# Altium schematic sheet Microcontroller.SchDoc
size A2; SheetNumber: 3; SheetTotal: 3
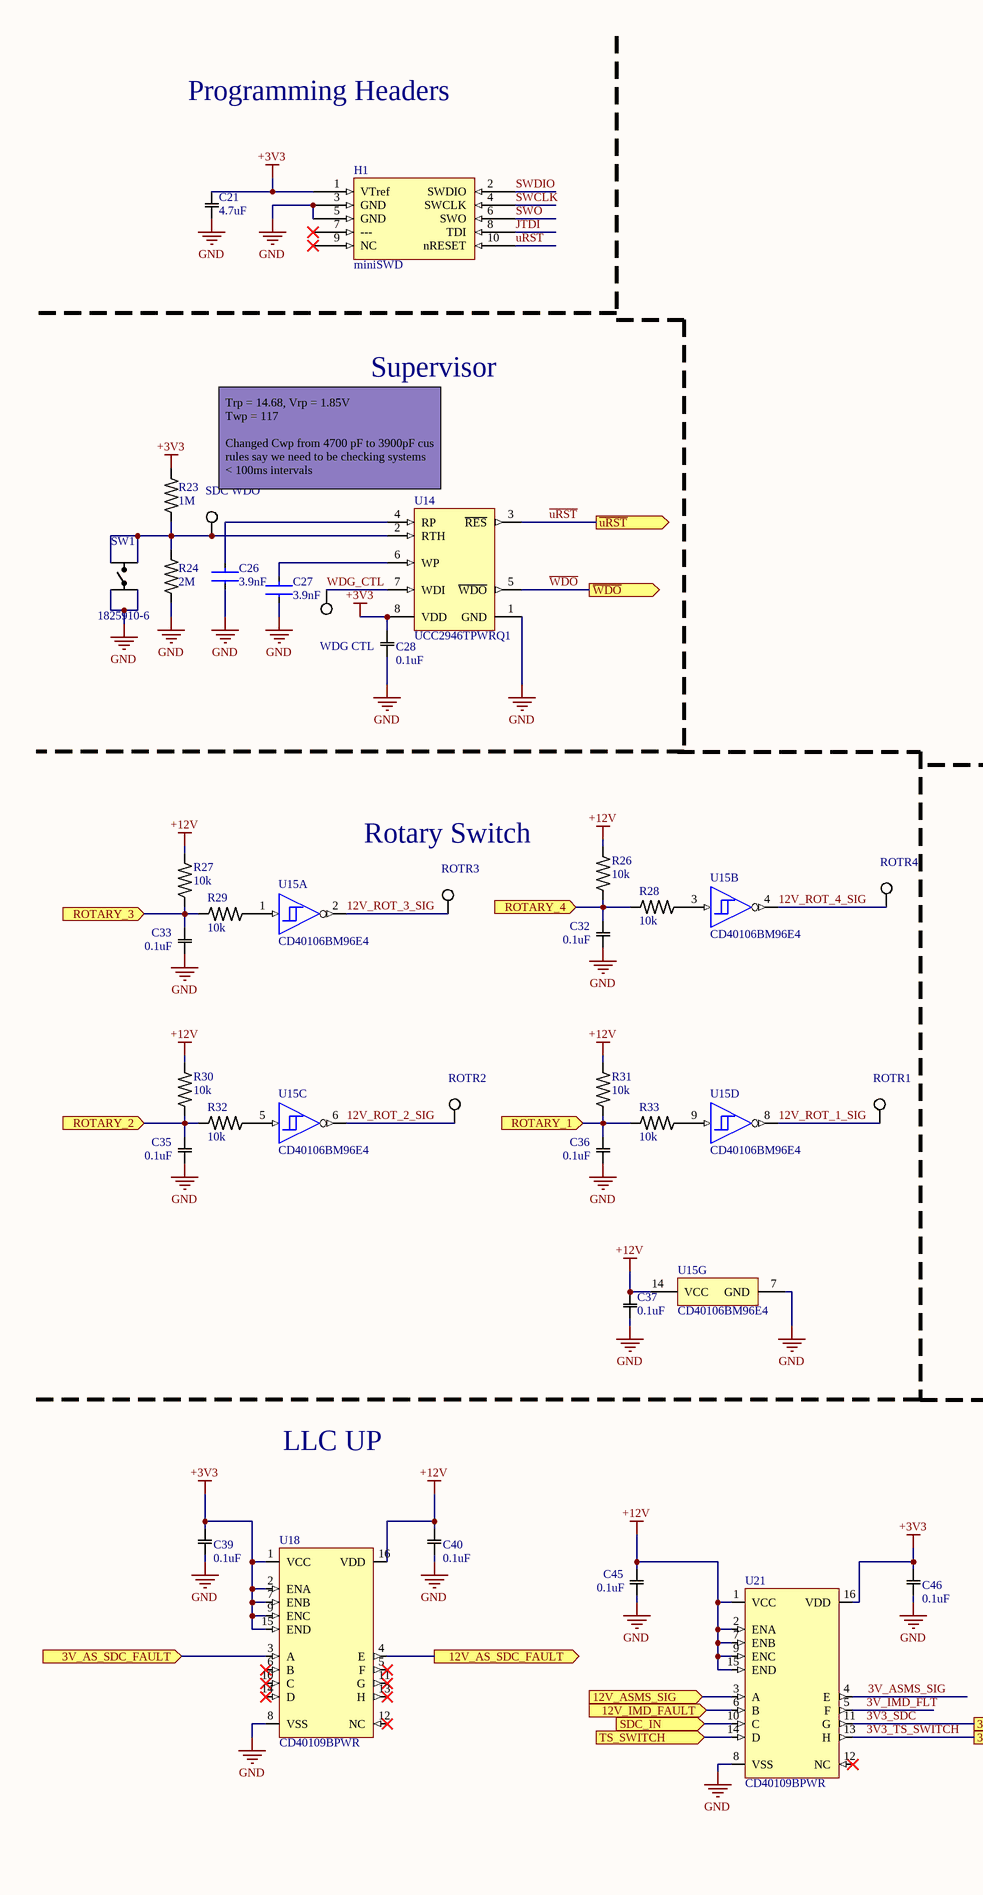
[diagram p0: Microcontroller.SchDoc, left]
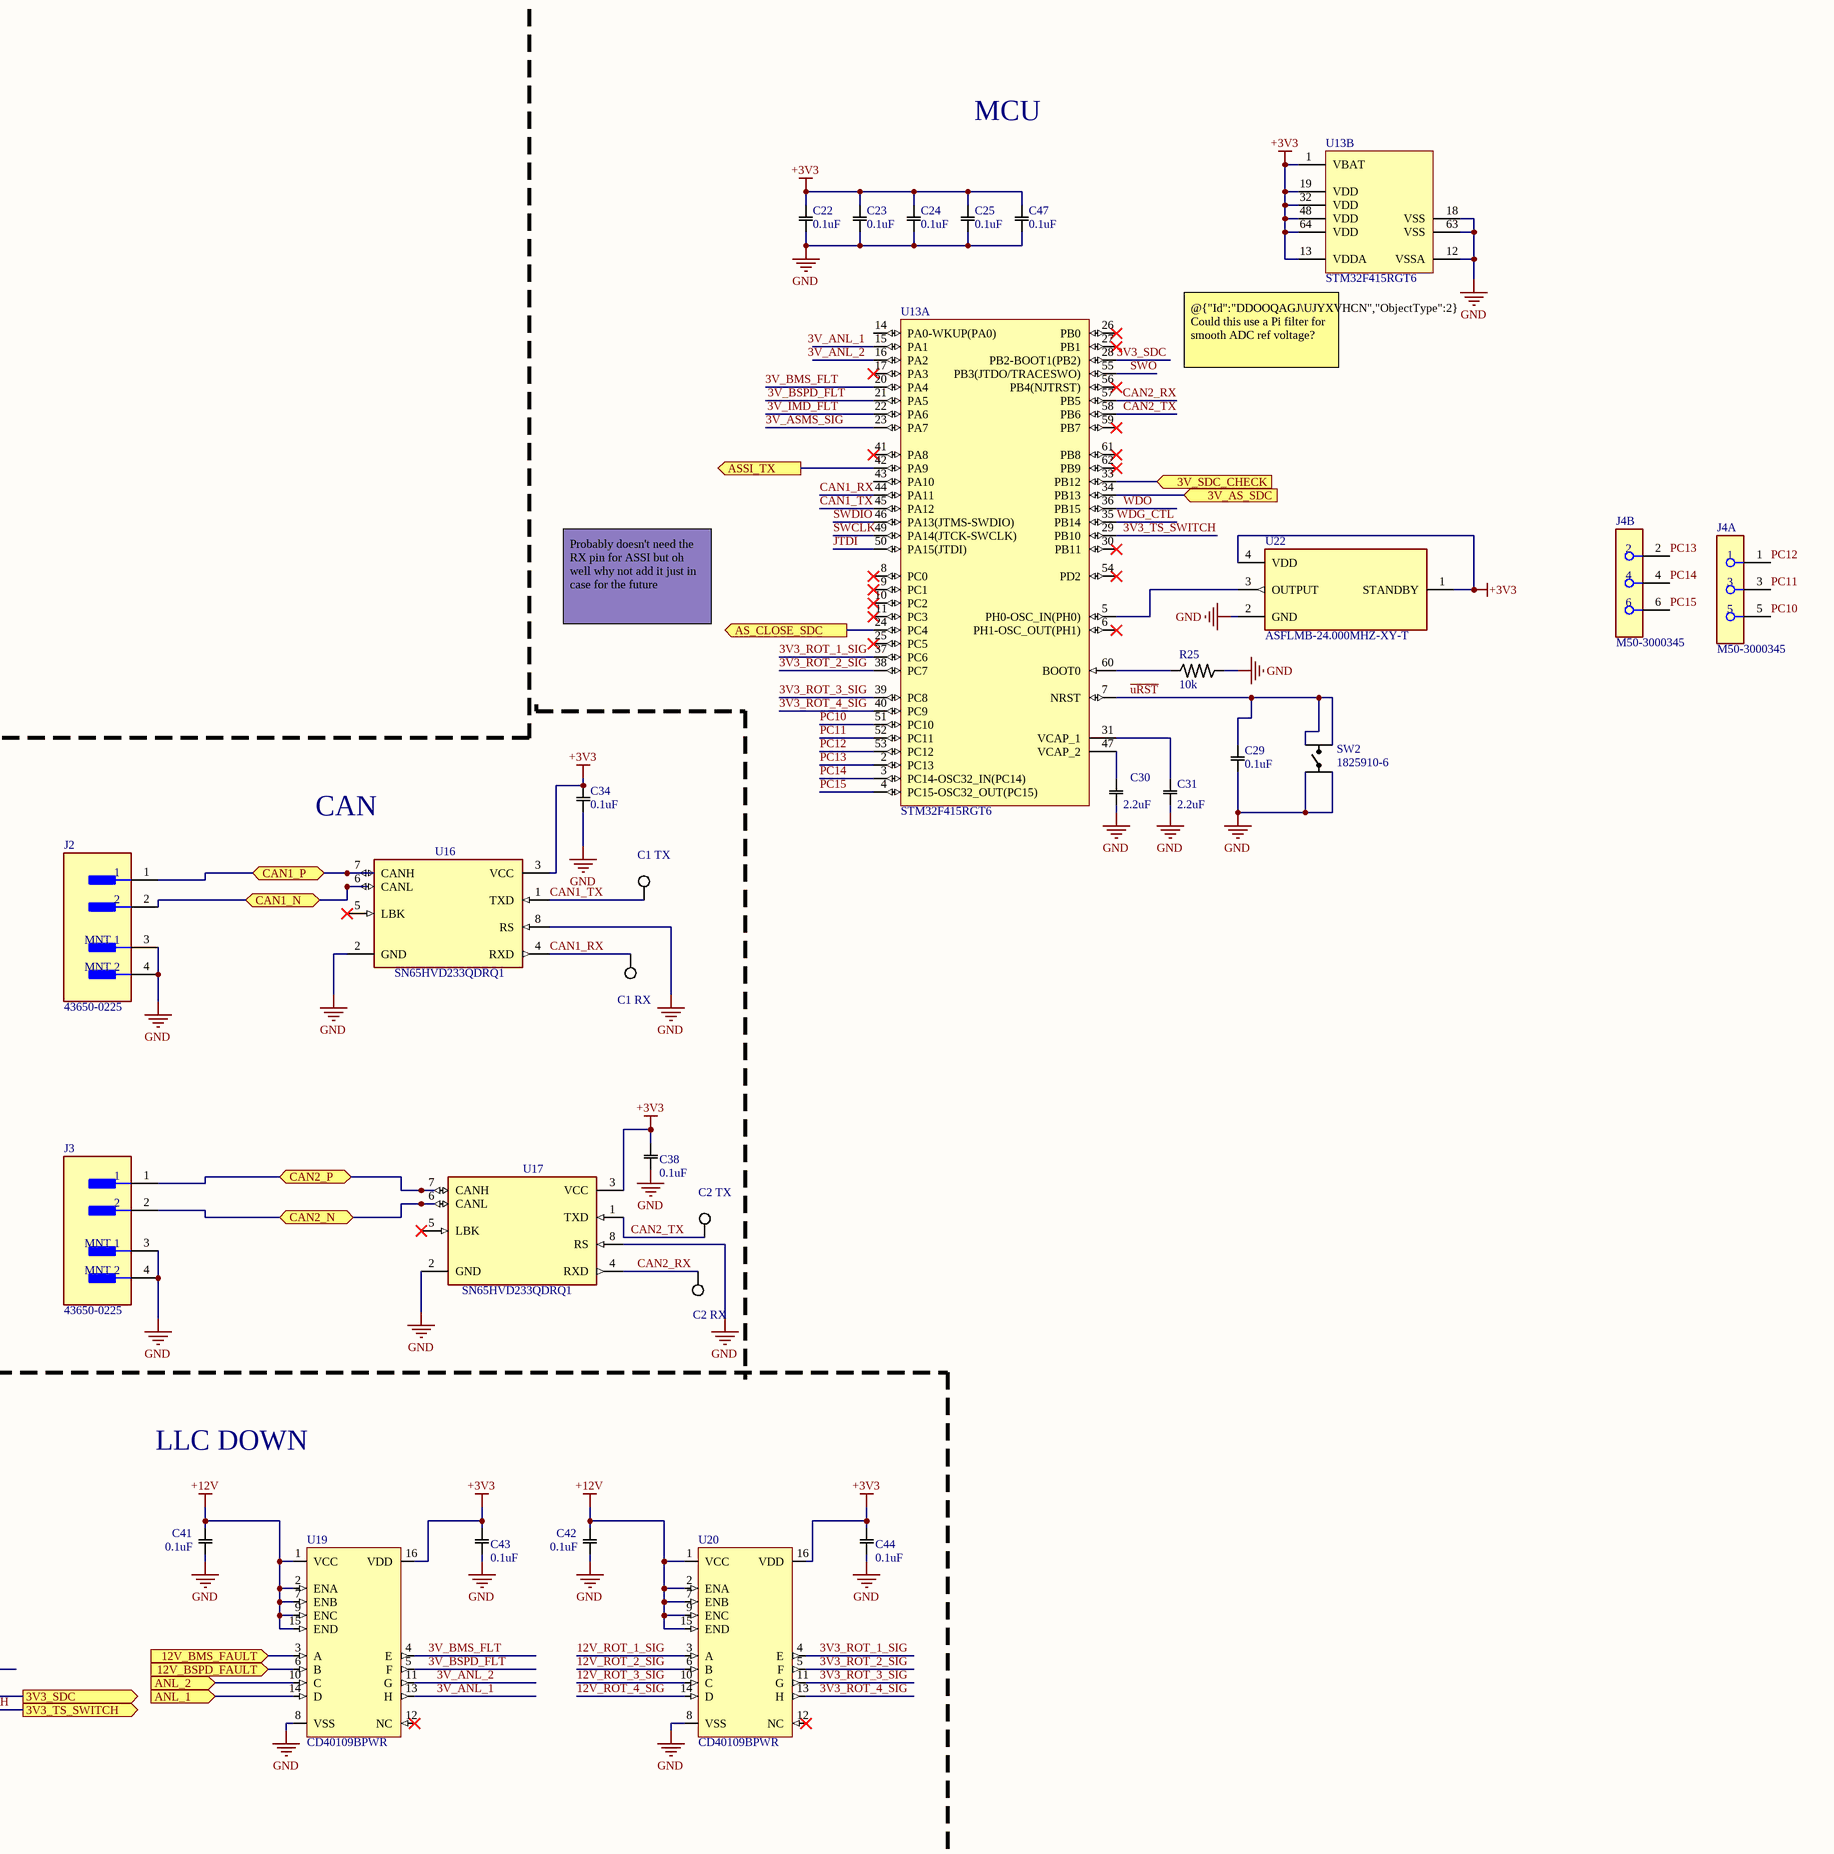
[diagram p1: Microcontroller.SchDoc, right]

## Parts
C1_RX  5012  [KSTN-5012_V]  (value not drawn)
C1_TX  5012  [KSTN-5012_V]  (value not drawn)
C2_RX  5012  [KSTN-5012_V]  (value not drawn)
C2_TX  5012  [KSTN-5012_V]  (value not drawn)
C21  value 4.7uF  [CAPC2012X14N]  (hidden comment: CL21A475KAQNNNE)
C22  value 0.1uF  [CAPC1608X09M]  (hidden comment: CL10B104KB8NNWC)
C23  value 0.1uF  [CAPC1608X09M]  (hidden comment: CL10B104KB8NNWC)
C24  value 0.1uF  [CAPC1608X09M]  (hidden comment: CL10B104KB8NNWC)
C25  value 0.1uF  [CAPC1608X09M]  (hidden comment: CL10B104KB8NNWC)
C26  value 3.9nF  [FP-GCM188-0_1-IPC_B]  (hidden comment: GCM1885C1H392JA16D)
C27  value 3.9nF  [FP-GCM188-0_1-IPC_B]  (hidden comment: GCM1885C1H392JA16D)
C28  value 0.1uF  [CAPC1608X09M]  (hidden comment: CL10B104KB8NNWC)
C29  value 0.1uF  [CAPC1608X09M]  (hidden comment: CL10B104KB8NNWC)
C30  value 2.2uF  [CAPC1608X09N]  (hidden comment: CL10A225KO8NNNC)
C31  value 2.2uF  [CAPC1608X09N]  (hidden comment: CL10A225KO8NNNC)
C32  value 0.1uF  [CAPC1608X09M]  (hidden comment: CL10B104KB8NNWC)
C33  value 0.1uF  [CAPC1608X09M]  (hidden comment: CL10B104KB8NNWC)
C34  value 0.1uF  [CAPC1608X09M]  (hidden comment: CL10B104KB8NNWC)
C35  value 0.1uF  [CAPC1608X09M]  (hidden comment: CL10B104KB8NNWC)
C36  value 0.1uF  [CAPC1608X09M]  (hidden comment: CL10B104KB8NNWC)
C37  value 0.1uF  [CAPC1608X09M]  (hidden comment: CL10B104KB8NNWC)
C38  value 0.1uF  [CAPC1608X09M]  (hidden comment: CL10B104KB8NNWC)
C39  value 0.1uF  [CAPC1608X09M]  (hidden comment: CL10B104KB8NNWC)
C40  value 0.1uF  [CAPC1608X09M]  (hidden comment: CL10B104KB8NNWC)
C41  value 0.1uF  [CAPC1608X09M]  (hidden comment: CL10B104KB8NNWC)
C42  value 0.1uF  [CAPC1608X09M]  (hidden comment: CL10B104KB8NNWC)
C43  value 0.1uF  [CAPC1608X09M]  (hidden comment: CL10B104KB8NNWC)
C44  value 0.1uF  [CAPC1608X09M]  (hidden comment: CL10B104KB8NNWC)
C45  value 0.1uF  [CAPC1608X09M]  (hidden comment: CL10B104KB8NNWC)
C46  value 0.1uF  [CAPC1608X09M]  (hidden comment: CL10B104KB8NNWC)
C47  value 0.1uF  [CAPC1608X09M]  (hidden comment: CL10B104KB8NNWC)
H1  miniSWD  [miniSWD-Footprint-1]
J2  43650-0225  [FP-43650-0225-MFG]
J3  43650-0225  [FP-43650-0225-MFG]
J4  M50-3000345  [FP-M50-3000345-MFG]  (parts A,B of 2)
R23  value 1M  [RESC1608X06N]  (hidden comment: RC0603FR-071ML)
R24  value 2M  [RESC1608X06N]  (hidden comment: RC0603FR-102ML)
R25  value 10k  [RESC1608X06N]  (hidden comment: ESR03EZPJ103)
R26  value 10k  [RESC1608X06N]  (hidden comment: ESR03EZPJ103)
R27  value 10k  [RESC1608X06N]  (hidden comment: ESR03EZPJ103)
R28  value 10k  [RESC1608X06N]  (hidden comment: ESR03EZPJ103)
R29  value 10k  [RESC1608X06N]  (hidden comment: ESR03EZPJ103)
R30  value 10k  [RESC1608X06N]  (hidden comment: ESR03EZPJ103)
R31  value 10k  [RESC1608X06N]  (hidden comment: ESR03EZPJ103)
R32  value 10k  [RESC1608X06N]  (hidden comment: ESR03EZPJ103)
R33  value 10k  [RESC1608X06N]  (hidden comment: ESR03EZPJ103)
ROTR1  5012  [KSTN-5012_V]  (value not drawn)
ROTR2  5012  [KSTN-5012_V]  (value not drawn)
ROTR3  5012  [KSTN-5012_V]  (value not drawn)
ROTR4  5012  [KSTN-5012_V]  (value not drawn)
SDC_WDO  5012  [KSTN-5012_V]  (value not drawn)
SW1  1825910-6  [SW1825910-6]
SW2  1825910-6  [SW1825910-6]
U13  STM32F415RGT6  [STM-LQFP64_M]  (parts A,B of 2)
U14  UCC2946TPWRQ1  [PW0008A_M]
U15  CD40106BM96E4  [D0014A_L]  (parts A,B,C,D,G of 7)
U16  SN65HVD233QDRQ1  [FP-D0008A-IPC_B]
U17  SN65HVD233QDRQ1  [FP-D0008A-IPC_B]
U18  CD40109BPWR  [TSOP65P640X120-16N]
U19  CD40109BPWR  [TSOP65P640X120-16N]
U20  CD40109BPWR  [TSOP65P640X120-16N]
U21  CD40109BPWR  [TSOP65P640X120-16N]
U22  ASFLMB-24.000MHZ-XY-T  [XTAL_ASFLMB-24.000MHZ-XY-T]
WDG_CTL  5012  [KSTN-5012_V]  (value not drawn)

## Ports
3V3_SDC (out, see DFMM_2024[7C], Non_Prog_Logic[2B]), 3V3_TS_SWITCH (out, see DFMM_2024[7B], Non_Prog_Logic[2A]), 3V_AS_SDC (in, see DFMM_2024[7B], Non_Prog_Logic[6A]), 3V_AS_SDC_FAULT (in, see DFMM_2024[7B], Non_Prog_Logic[3D]), 3V_SDC_CHECK (in, see DFMM_2024[7C], Non_Prog_Logic[6B]), 12V_AS_SDC_FAULT (out, see DFMM_2024[7B], Non_Prog_Logic[5D]), 12V_ASMS_SIG (in, see DFMM_2024[6B]), 12V_BMS_FAULT (in, see DFMM_2024[6B]), 12V_BSPD_FAULT (in, see DFMM_2024[6B]), 12V_IMD_FAULT (in, see DFMM_2024[6B]), ANL_1 (in, see DFMM_2024[7B]), ANL_2 (in, see DFMM_2024[7B]), AS_CLOSE_SDC (out, see DFMM_2024[7B], Non_Prog_Logic[2A]), ASSI_TX (out, see DFMM_2024[7C]), CAN1_N (bidir, see DFMM_2024[6C]), CAN1_P (bidir, see DFMM_2024[6C]), CAN2_N (bidir, see DFMM_2024[6C]), CAN2_P (bidir, see DFMM_2024[6C]), ROTARY_1 (in, see DFMM_2024[6B]), ROTARY_2 (in, see DFMM_2024[6B]), ROTARY_3 (in, see DFMM_2024[6B]), ROTARY_4 (in, see DFMM_2024[6B]), SDC_IN (in, see DFMM_2024[6C], Non_Prog_Logic[7C]), TS_SWITCH (in, see DFMM_2024[6B]), ~{uRST} (out, see DFMM_2024[7B], Non_Prog_Logic[4A]), ~{WDO} (out, see DFMM_2024[7C], Non_Prog_Logic[2B])

## Nets
+3V3: C21.1 C22.2 C23.2 C24.2 C25.2 C28.1 C34.1 C38.1 C39.1 C43.1 C44.1 C46.1 C47.2 H1.1(VTref) R23.2 U13.1(VBAT) U13.13(VDDA) U13.19(VDD) U13.32(VDD) U13.48(VDD) U13.64(VDD) U14.8(VDD) U16.3(VCC) U17.3(VCC) U18.1(VCC) U18.2(ENA) U18.7(ENB) U18.9(ENC) U18.15(END) U19.16(VDD) U20.16(VDD) U21.16(VDD) U22.1(STANDBY) U22.4(VDD)
+12V: C37.2 C40.1 C41.2 C42.2 C45.2 R26.1 R27.1 R30.1 R31.1 U15.14(VCC) U18.16(VDD) U19.1(VCC) U19.2(ENA) U19.7(ENB) U19.9(ENC) U19.15(END) U20.1(VCC) U20.2(ENA) U20.7(ENB) U20.9(ENC) U20.15(END) U21.1(VCC) U21.2(ENA) U21.7(ENB) U21.9(ENC) U21.15(END)
GND: C21.2 C22.1 C23.1 C24.1 C25.1 C26.2 C27.2 C28.2 C29.1 C30.2 C31.2 C32.1 C33.1 C34.2 C35.1 C36.1 C37.1 C38.2 C39.2 C40.2 C41.1 C42.1 C43.2 C44.2 C45.1 C46.2 C47.1 H1.3(GND) H1.5(GND) J2.3(MNT_1) J2.4(MNT_2) J3.3(MNT_1) J3.4(MNT_2) R24.1 R25.1 SW1.1 SW1.2 SW2.1 SW2.2 U13.12(VSSA) U13.18(VSS) U13.63(VSS) U14.1(GND) U15.7(GND) U16.2(GND) U16.8(RS) U17.2(GND) U17.8(RS) U18.8(VSS) U19.8(VSS) U20.8(VSS) U21.8(VSS) U22.2(GND)
3V3_ROT_1_SIG: U13.37(PC6) U20.4(E)
3V3_ROT_2_SIG: U13.38(PC7) U20.5(F)
3V3_ROT_3_SIG: U13.39(PC8) U20.11(G)
3V3_ROT_4_SIG: U13.40(PC9) U20.13(H)
3V3_SDC: U13.28(PB2-BOOT1(PB2)) U21.11(G) ; port 3V3_SDC
3V3_TS_SWITCH: U13.29(PB10) U21.13(H) ; port 3V3_TS_SWITCH
3V_ANL_1: U13.15(PA1) U19.13(H)
3V_ANL_2: U13.16(PA2) U19.11(G)
3V_AS_SDC: U13.34(PB13) ; port 3V_AS_SDC
3V_AS_SDC_FAULT: U18.3(A) ; port 3V_AS_SDC_FAULT
3V_ASMS_SIG: U13.23(PA7) U21.4(E)
3V_BMS_FLT: U13.20(PA4) U19.4(E)
3V_BSPD_FLT: U13.21(PA5) U19.5(F)
3V_IMD_FLT: U13.22(PA6) U21.5(F)
3V_SDC_CHECK: U13.33(PB12) ; port 3V_SDC_CHECK
12V_AS_SDC_FAULT: U18.4(E) ; port 12V_AS_SDC_FAULT
12V_ASMS_SIG: U21.3(A) ; port 12V_ASMS_SIG
12V_BMS_FAULT: U19.3(A) ; port 12V_BMS_FAULT
12V_BSPD_FAULT: U19.6(B) ; port 12V_BSPD_FAULT
12V_IMD_FAULT: U21.6(B) ; port 12V_IMD_FAULT
12V_ROT_1_SIG: ROTR1.1 U15.8(~{4Y}) U20.3(A)
12V_ROT_2_SIG: ROTR2.1 U15.6(~{3Y}) U20.6(B)
12V_ROT_3_SIG: ROTR3.1 U15.2(~{1Y}) U20.10(C)
12V_ROT_4_SIG: ROTR4.1 U15.4(~{2Y}) U20.14(D)
~{uRST}: C29.2 H1.10(nRESET) SW2.3 SW2.4 U13.7(NRST) U14.3(~{RES}) ; port ~{uRST}
~{WDO}: U13.36(PB15) U14.5(~{WDO}) ; port ~{WDO}
ANL_1: U19.14(D) ; port ANL_1
ANL_2: U19.10(C) ; port ANL_2
AS_CLOSE_SDC: U13.24(PC4) ; port AS_CLOSE_SDC
ASSI_TX: U13.42(PA9) ; port ASSI_TX
CAN1_N: J2.2 U16.6(CANL) ; port CAN1_N
CAN1_P: J2.1 U16.7(CANH) ; port CAN1_P
CAN1_RX: C1_RX.1 U13.44(PA11) U16.4(RXD)
CAN1_TX: C1_TX.1 U13.45(PA12) U16.1(TXD)
CAN2_N: J3.2 U17.6(CANL) ; port CAN2_N
CAN2_P: J3.1 U17.7(CANH) ; port CAN2_P
CAN2_RX: C2_RX.1 U13.57(PB5) U17.4(RXD)
CAN2_TX: C2_TX.1 U13.58(PB6) U17.1(TXD)
JTDI: H1.8(TDI) U13.50(PA15(JTDI))
PC10: J4.5 U13.51(PC10)
PC11: J4.3 U13.52(PC11)
PC12: J4.1 U13.53(PC12)
PC13: J4.2 U13.2(PC13)
PC14: J4.4 U13.3(PC14-OSC32_IN(PC14))
PC15: J4.6 U13.4(PC15-OSC32_OUT(PC15))
ROTARY_1: C36.2 R31.2 R33.1 ; port ROTARY_1
ROTARY_2: C35.2 R30.2 R32.1 ; port ROTARY_2
ROTARY_3: C33.2 R27.2 R29.1 ; port ROTARY_3
ROTARY_4: C32.2 R26.2 R28.1 ; port ROTARY_4
SDC_IN: U21.10(C) ; port SDC_IN
SWCLK: H1.4(SWCLK) U13.49(PA14(JTCK-SWCLK))
SWDIO: H1.2(SWDIO) U13.46(PA13(JTMS-SWDIO))
SWO: H1.6(SWO) U13.55(PB3(JTDO/TRACESWO))
TS_SWITCH: U21.14(D) ; port TS_SWITCH
WDG_CTL: U13.35(PB14) U14.7(WDI) WDG_CTL.1
NetC26_1: C26.1 U14.4(RP)
NetC27_1: C27.1 U14.6(WP)
NetC30_1: C30.1 U13.47(VCAP_2)
NetC31_1: C31.1 U13.31(VCAP_1)
NetR23_1: R23.1 R24.2 SDC_WDO.1 SW1.3 SW1.4 U14.2(RTH)
NetR25_2: R25.2 U13.60(BOOT0)
NetR28_2: R28.2 U15.3(2A)
NetR29_2: R29.2 U15.1(1A)
NetR32_2: R32.2 U15.5(3A)
NetR33_2: R33.2 U15.9(4A)
NetU13_5: U13.5(PH0-OSC_IN(PH0)) U22.3(OUTPUT)

Not connected (* = marked no-connect by the designer): H1 7(---)* 9(NC)*; U13 6(PH1-OSC_OUT(PH1))* 8(PC0)* 9(PC1)* 10(PC2)* 11(PC3)* 14(PA0-WKUP(PA0)) 17(PA3)* 25(PC5)* 26(PB0)* 27(PB1)* 30(PB11)* 41(PA8)* 43(PA10) 54(PD2)* 56(PB4(NJTRST))* 59(PB7)* 61(PB8)* 62(PB9)*; U16 5(LBK)*; U17 5(LBK)*; U18 5(F)* 6(B)* 10(C)* 11(G)* 12(NC)* 13(H)* 14(D)*; U19 12(NC)*; U20 12(NC)*; U21 12(NC)*

## Notes on the sheet
- Programming Headers
- MCU
- Supervisor
- (near U13) @{"Id":"DDOOQAGJ\UJYXVHCN","ObjectType":2} Could this use a Pi filter for smooth ADC ref voltage?
- Trp = 14.68, Vrp = 1.85V
  Twp = 117
  Changed Cwp from 4700 pF to 3900pF cus rules say we need to be checking systems < 100ms intervals
- Probably doesn't need the RX pin for ASSI but oh well why not add it just in case for the future
- Rotary Switch
- (near U16) CAN
- LLC UP
- LLC DOWN
- Sheet Title:
- FSAE Part Number:
- Updated:
- Date:
- Approved:
- Checked:
- Revision:
- Sheet
- of
- Description:

## Library data of the parts
C1_RX C1_TX C2_RX C2_TX ROTR1-ROTR4 SDC_WDO WDG_CTL = CMP-008-000006-1: PC TEST POINT MULTIPURPOSE WHITE; Manufacturer: Keystone Electronics; SPN: 36-5012-ND; Supplier: Digi=Key; Link: https://www.digikey.com.au/en/products/detail/keystone-electronics/5012/255334; MPN: 5012
C21 = CMP-001-00000-1: CAP CER 4.7UF 25V X5R 0805; Manufacturer: Samsung Electro-Mechanics; SPN: 1276-1244-1-ND; MPN: CL21A475KAQNNNE; Link: https://www.digikey.com.au/en/products/detail/samsung-electro-mechanics/CL21A475KAQNNNE/3886902; Supplier: Digi-Key
C22-C25 C28 C29 C32-C47 = CMP-001-00001-2: CAP CER 0.1UF 50V X7R 0603; Manufacturer: Samsung Electro-Mechanics; SPN: 1276-1935-1-ND; Link: https://www.digikey.com.au/en/products/detail/samsung-electro-mechanics/CL10B104KB8NNWC/3887593; Supplier: Digi-Key; MPN: CL10B104KB8NNWC
C26 C27 = CMP-00065-1: Multilayer Ceramic Capacitor, 3900 pF, 50 V, ± 5%, C0G (NP0), 0603 [1608 Metric]; Voltage Rating: 50V; Weight: 0.000222oz; Case/Package: 0603; Mounting Technology: Surface Mount; Package Quantity: 4000; Tolerance: 5%; Min Operating Temperature: -55°C; Series: GCM; Max Operating Temperature: 125°C; Lead Free: Lead Free; Width: 0.031inch; Packaging: Tape and Reel; Ratings: AEC-Q200; RoHS Compliant: Yes; Case Code (Metric): 1608; Thickness: 0.035inch; Height: 0.8mm; Termination: SMD/SMT; Case Code (Imperial): 0603; Length: 0.063inch; Dielectric: C0G; Voltage Rating (DC): 50V
C30 C31 = CMP-001-00005-1: CAP, 2.2UF, 16V, MLCC, 0603; SVHC: No SVHC (15-Jan-2019) RoHS Compliant: Yes; Manufacturer: Samsung Electro-Mechanics; MPN: CL10B472KB8NNNC; Material: Ceramic; Tolerance: 10%; Dielectric: X5R; SPN: 1276-1098-1-ND; RoHS Compliant: Yes; Depth: 0.8mm; Voltage: 16V; Height: 0.8mm; Voltage Rating (DC): 16V; Radiation Hardening: No; Link: https://www.digikey.com.au/en/products/detail/samsung-electro-mechanics/CL10B472KB8NNNC/3886756; Length: 1.6mm; Case Code (Imperial): 0603; Max Operating Temperature: 85°C; Min Operating Temperature: -55°C; Voltage Rating: 16V; Case Code (Metric): 1608; Series: CL; Case/Package: 0603; Construction: Flat; Mounting Technology: Surface Mount; Supplier: Digi-Key; Lead Free: Lead Free; Packaging: Tape and Reel
H1 = CMP-002-00001-4: miniSWD Header; MPN: FTSH-105-01-L-DV-K-P-TR; Manufacturer: Samtec Inc.; SPN: SAM13164CT-ND; Link: https://www.digikey.com.au/en/products/detail/samtec-inc/FTSH-105-01-L-DV-K-P-TR/5305483; Supplier: Digi-Key
J2 J3 = CMP-04776-000951-1: CONN HEADER SMD 2POS 3MM; Number of Contacts: 2; Glow Wire Compliant: Compliant; Number of Ports: 1; Current Rating: 5A; Gender: Male; Voltage Rating (DC): 250V; Voltage Rating: 600V; Insulation Resistance: 1GR; Contact Plating: Gold; Color: Black; Termination: Solder; Series: 43650; Number of Rows: 1; Contact Material: Brass; Flammability Rating: UL94 V-0; Pitch: 3mm; Number of Terminals/Pins: 2; Number of Circuits: 2; Mount: Surface Mount; Orientation: Vertical; Length: 13.65mm; Number of Positions: 2; Package Quantity: 1800; Halogen Free: Low Halogen; Radiation Hardening: No; Min Operating Temperature: -40°C; RoHS Compliant: Yes; Depth: 5.57mm; Housing Material: Thermoplastic; Max Operating Temperature: 105°C; Packaging: Tape and Reel
J4 = CMP-15831-000104-1: CONN RCPT 6POS 0.05 GOLD PCB; Pitch: 1.27mm; Mated Stacking Heights: 9.37mm; Gender: Female; Number of Positions: 6; Connector Type: Receptacle; Contact Finish - Mating: GOLD; Contact Plating: Gold; Contact Material: Bronze; Depth: 3.1mm; Contact Type: Female Socket; Max Operating Temperature: 105°C; Contact Shape: Square; Series: Archer M50; Packaging: Rail/Tube; RoHS Compliant: Yes; Length: 4.31mm; Number of Rows: 2; Fastening Type: Pull; Min Operating Temperature: -40°C; Flammability Rating: UL94 V-0; Termination: Solder; Insulation Color: Black; Insulation Material: Nylon; Orientation: Straight
R23 = CMP-009-00013-1: Thick Film Resistors 1 MOhms 100mW 0603 1%; Manufacturer: YAGEO; SPN: 603-RC0603FR-071ML; MPN: RC0603FR-071ML; Supplier: Mouser; Link: https://au.mouser.com/ProductDetail/YAGEO/RC0603FR-071ML?qs=sGAEpiMZZMvdGkrng054t3pr%252BPE%2FADjsD43MFxJGzcQ%3D
R24 = CMP-009-00014-1: Thick Film Resistors 2 MOhms 100 mW 0603 1%; Manufacturer: YAGEO; SPN: 603-RC0603FR-102ML; Supplier: Mouser; MPN: RC0603FR-102ML; Link: https://au.mouser.com/ProductDetail/YAGEO/RC0603FR-102ML?qs=sGAEpiMZZMvdGkrng054tz1y1XEHv7sNk7dsphdWXPuKRj8%252B%252BghJng%3D%3D
R25-R33 = CMP-00017-5: RES SMD 10K OHM 5% 1/4W 0603; Manufacturer: Rohm Semiconductor; SPN: RHM10KDCT-ND; Supplier: Digi-Key; Link: https://www.digikey.com.au/en/products/detail/rohm-semiconductor/ESR03EZPJ103/1762722; MPN: ESR03EZPJ103
SW1 SW2 = CMP-00030-3: SWITCH TACTILE SPST-NO 0.05A 24V; Manufacturer: TE Connectivity ALCOSWITCH Switches; SPN: 450-1650-ND; Supplier: Digi-Key; Link: https://www.digikey.com.au/en/products/detail/te-connectivity-alcoswitch-switches/1825910-6/1632536; MPN: 1825910-6
U13 = CMP-00054-1: MCU 32-bit STM32F ARM Cortex M4F RISC 1024KB Flash 2.5V/3.3V 64-Pin LQFP Tray; Manufacturer: STMicroelectronics; SPN: 511-STM32F415RGT6; Link: https://au.mouser.com/ProductDetail/STMicroelectronics/STM32F415RGT6?qs=Z8%252BeY1k3TIInWw2QSLYjXw%3D%3D; MPN: STM32F415RGT6; Supplier: Mouser
U14 = CMP-00052-1: Automotive, 2.1-V to 5.5-V microprocessor supervisor with watchdog timer 8-TSSOP -40 to 105; Manufacturer: Texas Instruments; SPN: 595-UCC2946TPWRQ1; Link: https://au.mouser.com/ProductDetail/Texas-Instruments/UCC2946TPWRQ1?qs=%252BEXHTxrSws6LDeqFfQ4KYg%3D%3D; Supplier: Mouser; MPN: UCC2946TPWRQ1
U15 = CMP-00041-2: 6-ch, 4.5-V to 5.5-V inverters with Schmitt-Trigger inputs 14-SOIC -40 to 85; Manufacturer: Texas Instruments; SPN: 595-CD40106BM96E4; Link: https://au.mouser.com/ProductDetail/Texas-Instruments/CD40106BM96E4?qs=UFeyouyReuGsJCXwNW9Exg%3D%3D; MPN: CD40106BM96E4; Supplier: Mouser
U16 U17 = CMP-00076-1: 3.3-V Automotive CAN Bus Transceivers 8-SOIC -40 to 125
U18-U21 = CMP-00033-1: IC TRANSLATOR UNIDIR 16TSSOP; Manufacturer: Texas Instruments; SPN: 296-12163-1-ND; MPN: CD40109BPWR; Supplier: Digi-Key; Link: https://www.digikey.com.au/en/products/detail/texas-instruments/CD40109BPWR/412006
U22 = CMP-085-000000-1: Design Item ID: ASFLMB-24.000MHZ-XY-T; Component Type: Standard; Value: *; Pin Count: 4; Price: None; Package: None; Availability: Unavailable; Source: ASFLMB-24.000MHZ-XY-T.SchLib; MP: ASFLMB-24.000MHZ-XY-T